# Altium schematic sheet Board-Connectors.SchDoc
size 420 x 297 mm; SheetNumber: 4; SheetTotal: 4
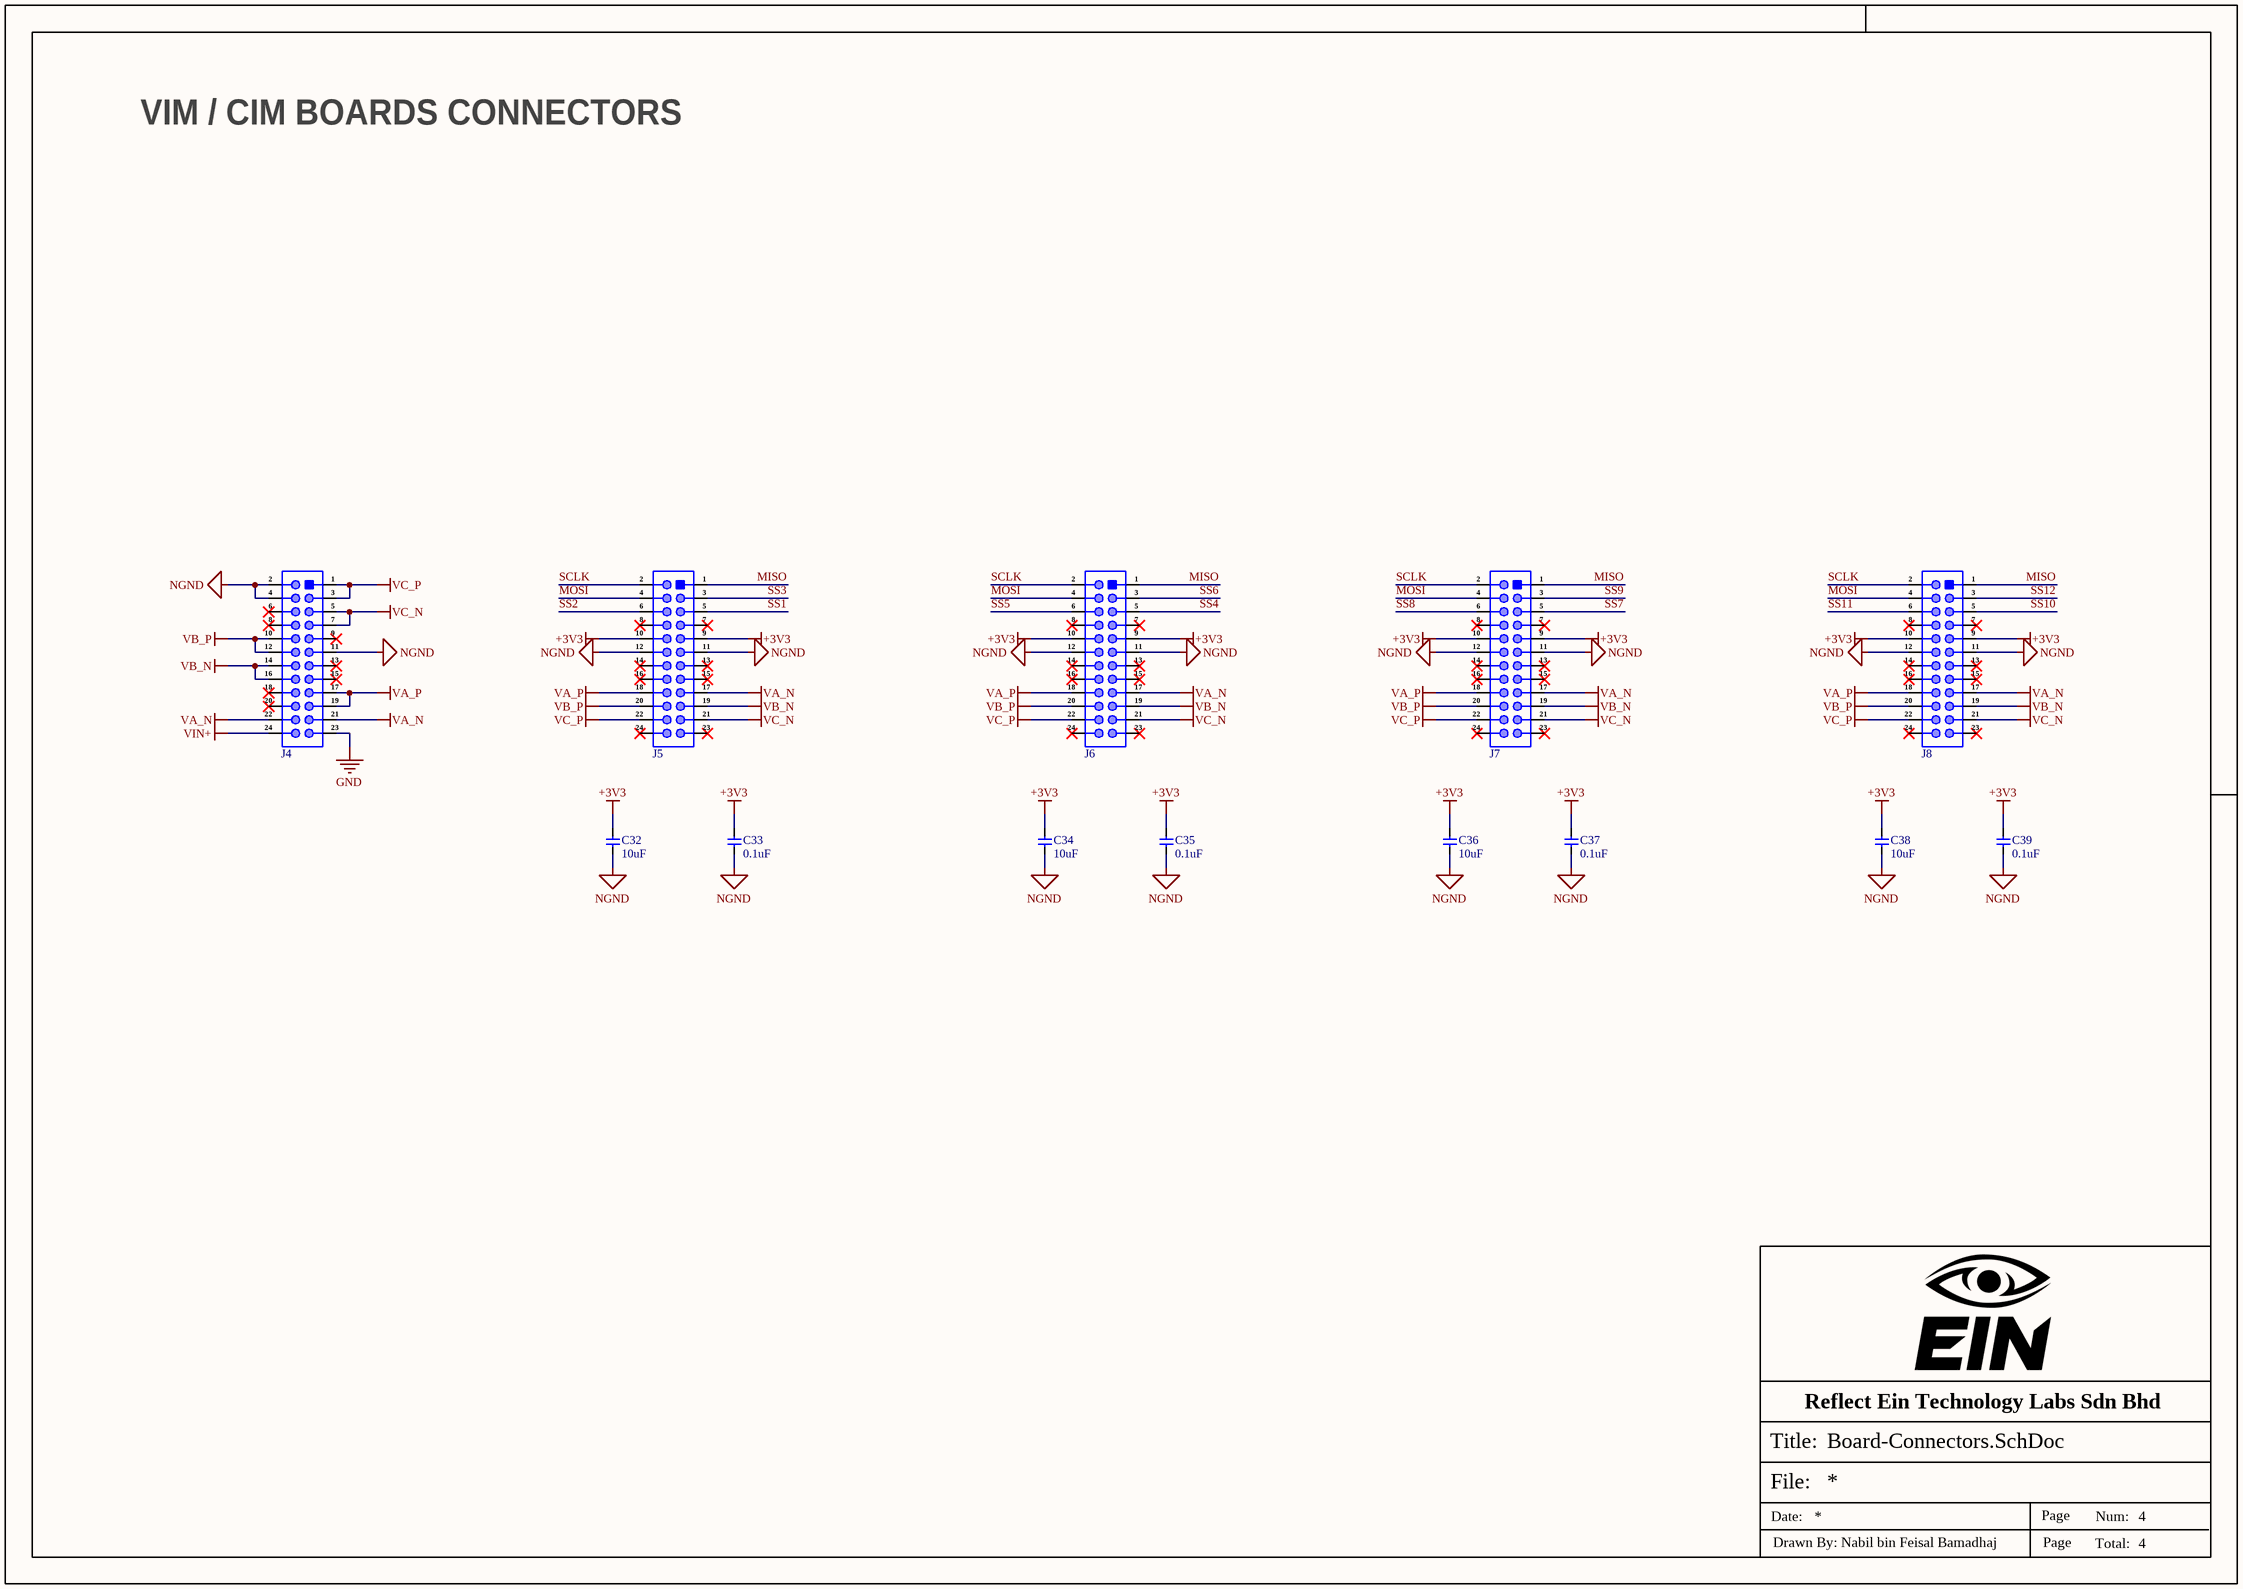
[diagram p0: Board-Connectors.SchDoc]

## Parts
C32  10uF  [Cap-0603]
C33  0.1uF  [Cap-0603]
C34  10uF  [Cap-0603]
C35  0.1uF  [Cap-0603]
C36  10uF  [Cap-0603]
C37  0.1uF  [Cap-0603]
C38  10uF  [Cap-0603]
C39  0.1uF  [Cap-0603]
J4  X9555WV-2x12-6TV01  [X9555WV-2x12-6TV01]  (value not drawn)
J5  X9555WV-2x12-6TV01  [X9555WV-2x12-6TV01]  (value not drawn)
J6  X9555WV-2x12-6TV01  [X9555WV-2x12-6TV01]  (value not drawn)
J7  X9555WV-2x12-6TV01  [X9555WV-2x12-6TV01]  (value not drawn)
J8  X9555WV-2x12-6TV01  [X9555WV-2x12-6TV01]  (value not drawn)

## Nets
+3V3: C32.2 C33.2 C34.2 C35.2 C36.2 C37.2 C38.2 C39.2 J5.9 J5.10 J6.9 J6.10 J7.9 J7.10 J8.9 J8.10
GND: J4.23
NGND: C32.1 C33.1 C34.1 C35.1 C36.1 C37.1 C38.1 C39.1 J4.2 J4.4 J4.11 J5.11 J5.12 J6.11 J6.12 J7.11 J7.12 J8.11 J8.12
VA_N: J4.21 J4.22 J5.17 J6.17 J7.17 J8.17
VA_P: J4.17 J4.19 J5.18 J6.18 J7.18 J8.18
VB_N: J4.14 J4.16 J5.19 J6.19 J7.19 J8.19
VB_P: J4.10 J4.12 J5.20 J6.20 J7.20 J8.20
VC_N: J4.5 J4.7 J5.21 J6.21 J7.21 J8.21
VC_P: J4.1 J4.3 J5.22 J6.22 J7.22 J8.22
VIN+: J4.24
MISO: J5.1 J6.1 J7.1 J8.1
MOSI: J5.4 J6.4 J7.4 J8.4
SCLK: J5.2 J6.2 J7.2 J8.2
SS1: J5.5
SS2: J5.6
SS3: J5.3
SS4: J6.5
SS5: J6.6
SS6: J6.3
SS7: J7.5
SS8: J7.6
SS9: J7.3
SS10: J8.5
SS11: J8.6
SS12: J8.3

Not connected (* = marked no-connect by the designer): J4 6* 8* 9* 13* 15* 18* 20*; J5 7* 8* 13* 14* 15* 16* 23* 24*; J6 7* 8* 13* 14* 15* 16* 23* 24*; J7 7* 8* 13* 14* 15* 16* 23* 24*; J8 7* 8* 13* 14* 15* 16* 23* 24*

## Notes on the sheet
- VIM / CIM BOARDS CONNECTORS
- Reflect Ein Technology Labs Sdn Bhd
- File:
- Title:
- Date:
- Page
- Num:
- Total:
- Drawn By: Nabil bin Feisal Bamadhaj

## Library data of the parts
C32 C34 C36 C38 = GRM188Z71A106KA73D: CAP CER 10UF 10V X7R 0603; Manufacturer: Murata; Item Type: Capacitor; Material: 4241ConductorMaterial; Tolerance: 10%; Supplier: Mouser; LCSC Part Number: C2959727; Manufacturer Part Number: GRM188Z71A106KA73D; RoHS: Yes; Stock: 390983; Pricing: 1=0.36, 10=0.155, 50=0.155, 100=0.104, 1000=0.094, 10000=0.065 (USD); Case/Package: 345Case; Min Operating Temperature: -55°C; Max Operating Temperature: 125°C; Value: 10uF; Voltage Rating: 10V; Length: 1.6mm; Width: 800um; Height: 1mm; Thickness: 800um; RoHS Compliant: Yes; ComponentLink1URL: https://datasheet.octopart.com/GRM188Z71A106KA73D-Murata-datasheet-165579666.pdf?src-supplier=TME; ComponentLink1Description: https://datasheet.octopart.com/GRM188Z71A106KA73D-Murata-datasheet-165579666.pdf?src-supplier=TME
C33 C35 C37 C39 = GCJ188R71H104KA12D: CAP CER 0.1UF 50V X7R 0603; Manufacturer: Murata; Item Type: Capacitors; Material: 4241ConductorMaterial; Value: 100nF; Tolerance: 10%; Supplier: Mouser; LCSC Part Number: C161115; Manufacturer Part Number: GCJ188R71H104KA12D; RoHS: Yes; Stock: 342536; Pricing: 1=0.13, 10=0.056, 50=0.056, 100=0.036, 1000=0.032, 10000=0.02 (USD); Mounting Technology: Surface Mount; Case/Package: 0603; Case Code (Metric): 1608; Case Code (Imperial): 0603; Min Operating Temperature: -55°C; Max Operating Temperature: 125°C; Dielectric: X7R; Package Quantity: 1; Voltage Rating: 50V; Packaging: Tape and Reel; Voltage Rating (DC): 50V; Termination: SMD/SMT; Features: Soft Termination; Series: GCJ; Construction: Flat; Length: 1.6mm; Width: 0.031inch; Height: 0.8mm; Thickness: 0.035inch; Depth: 0.8mm; Ratings: AEC-Q200; Radiation Hardening: No; RoHS Compliant: Yes; Lead Free: 5697LeadFree; ComponentLink1URL: https://datasheet.ciiva.com/135/product-135604.pdf?src-supplier=Digikey; ComponentLink1Description: https://datasheet.ciiva.com/135/product-135604.pdf?src-supplier=Digikey; ComponentLink2URL: https://datasheet.ciiva.com/26889/getdatasheetpartid-369886-26889118.pdf?src-supplier=Verical; ComponentLink2Description: https://datasheet.ciiva.com/26889/getdatasheetpartid-369886-26889118.pdf?src-supplier=Verical; ComponentLink3URL: https://datasheet.ciiva.com/135/s0717e-135605.pdf?src-supplier=Digikey; ComponentLink3Description: https://datasheet.ciiva.com/135/s0717e-135605.pdf?src-supplier=Digikey; ComponentLink4URL: https://datasheet.ciiva.com/135/s0717e-135606.pdf?src-supplier=Digikey; ComponentLink4Description: https://datasheet.ciiva.com/135/s0717e-135606.pdf?src-supplier=Digikey; ComponentLink5URL: https://datasheet.ciiva.com/16440/c03e-16440425.pdf?src-supplier=Future+Electronics; ComponentLink5Description: https://datasheet.ciiva.com/16440/c03e-16440425.pdf?src-supplier=Future+Electronics
J4-J8 = X9555WV-2x12-6TV01: 2x12P 24P 2 Tin 2.54mm 2.54mm 12 3A Brass Direct Insert Plugin,P=2.54mm Wire To Board Connector ROHS; Manufacturer: XKB Connectivity; Supplier: LCSC; LCSC Part Number: C692425; Manufacturer Part Number: X9555WV-2x12-6TV01; RoHS: No; Item Type: Wire to Board Connector; Pricing: 5=0.315, 50=0.2544, 250=0.2058, 500=0.1734, 2000=0.1589, 5000=0.1503 (USD)